# Altium schematic sheet Top_Sheet.SchDoc
size A4
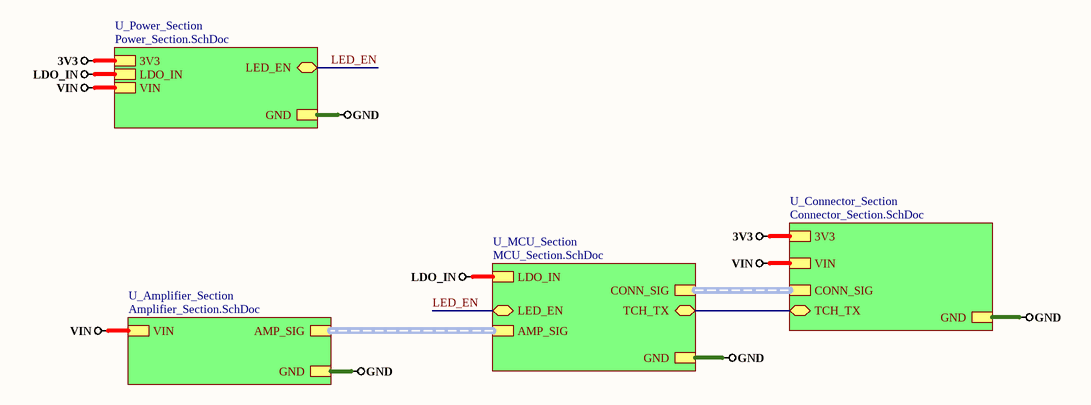
[diagram p0: Top_Sheet.SchDoc]

## Sub-sheets
U_Amplifier_Section = Amplifier_Section.SchDoc: AMP_SIG (harness AMP_SIG), VIN, GND
U_Connector_Section = Connector_Section.SchDoc: CONN_SIG (harness CONN_SIG), 3V3, GND, VIN, TCH_TX (bidir)
U_MCU_Section = MCU_Section.SchDoc: AMP_SIG (harness AMP_SIG), CONN_SIG (harness CONN_SIG), GND, LDO_IN, LED_EN (bidir), TCH_TX (bidir)
U_Power_Section = Power_Section.SchDoc: 3V3, GND, LDO_IN, VIN, LED_EN (bidir)

## Nets
3V3: sheet U_Connector_Section/3V3, sheet U_Power_Section/3V3
GND: sheet U_MCU_Section/GND, sheet U_Connector_Section/GND, sheet U_Amplifier_Section/GND, sheet U_Power_Section/GND
LDO_IN: sheet U_MCU_Section/LDO_IN, sheet U_Power_Section/LDO_IN
VIN: sheet U_Connector_Section/VIN, sheet U_Amplifier_Section/VIN, sheet U_Power_Section/VIN
LED_EN: sheet U_MCU_Section/LED_EN, sheet U_Power_Section/LED_EN
(unnamed): sheet U_MCU_Section/TCH_TX, sheet U_Connector_Section/TCH_TX

## Buses and harness runs
harness sheet U_Amplifier_Section/AMP_SIG = sheet U_MCU_Section/AMP_SIG
harness sheet U_Connector_Section/CONN_SIG = sheet U_MCU_Section/CONN_SIG